# Altium schematic sheet 200_DC-DC.SchDoc: DC_DC Convertion Stage
size A4; Date: xxxxxx; Author: R.Ducuara; DrawnBy: J.Jaramillo; Revision: R1V0; SheetNumber: 3; SheetTotal: 7
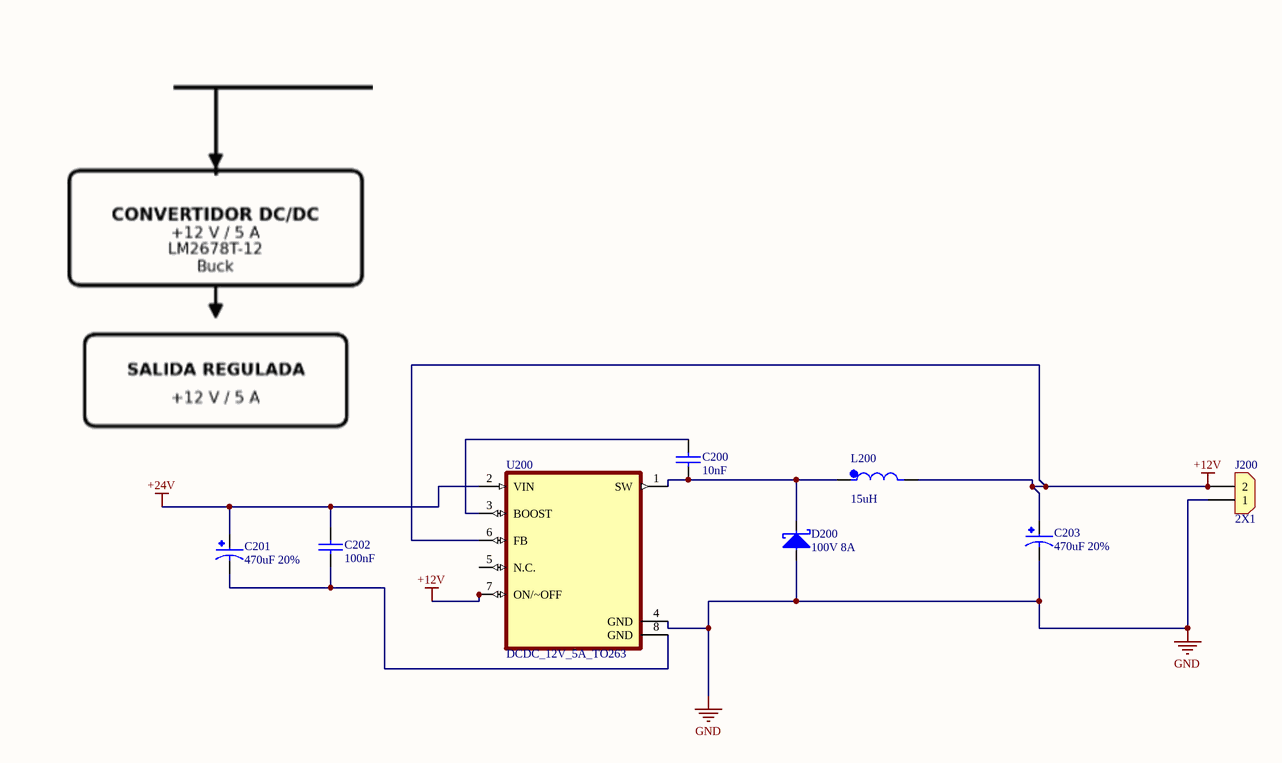
[diagram p0: 200_DC-DC.SchDoc]

## Parts
C200  value 10nF  [0805]  (hidden comment: 10000pF 50V)
C201  470uF 20%  [Cap_470uF_35V_ALUM_RAD]
C202  value 100nF  [1206]  (hidden comment: 100nF 100V)
C203  470uF 20%  [Cap_470uF_35V_ALUM_RAD]
D200  100V 8A  [DO_214AB]
J200  2X1  [CON_2X1_TH_5MM_BAT]
L200  15uH  [L_15uH_7A_SMD]
U200  DCDC_12V_5A_TO263  [DCDC_12V_5A_TO263]

## Nets
+12V: C203.P J200.2 L200.2 U200.6(FB) U200.7(ON/~OFF)
+24V: C201.P C202.1 U200.2(VIN)
GND: C203.N D200.2 J200.1 U200.4(GND)
NetC200_1: C200.1 U200.3(BOOST)
NetC200_2: C200.2 D200.1 L200.1 U200.1(SW)
NetC201_N: C201.N C202.2 U200.8(GND)

Not connected (* = marked no-connect by the designer): U200 5(N.C.)

## Notes on the sheet
- Title:
- Project:
- File:
- Revision:
- Date:
- Size:
- A4
- Drawn by:

## Library data of the parts
C200 = Cap_10000pF_0805_50V: CAP CER 10000PF 50V X7R 0805; Manufacturer: Yageo; Manufacturer Part Number: CC0805JRX7R9BB103; Supplier 1: Digi-Key; Supplier Part Number 1: 311-1857-1-ND; Reel stock: N/A; Last modified by: J.Jaramillo; Last modified date: 20240309; ComponentLink1Description: Digi-Key; ComponentLink1URL: https://www.digikey.com/product-detail/en/yageo/CC0805JRX7R9BB103/311-1857-1-ND/5195759
C201 C203 = Cap_470uF_35V_ALUM_RAD: CAP ALUM 470UF 20% 35V RADIAL TH; Manufacturer: Panasonic Industry; Manufacturer Part Number: ECA-1VM471B; Supplier 1: Digi-Key; Supplier Part Number 1: 10-ECA-1VM471BCT-ND; Last modified by: R.Ducuara; Last modified date: 20261121; Value: 470uF
C202 = Cap_0.1uF_1206_100V: CAP CER 0.1UF 100V X7R 1206; Manufacturer: Samsung Electro-Mechanics; Manufacturer Part Number: CL31B104KCFNNNE; Supplier 1: Digi-Key; Supplier Part Number 1: 1276-1151-1-ND; Last modified by: J.Jaramillo; Last modified date: 20240309; ComponentLink1Description: Digi-Key; ComponentLink1URL: https://www.digikey.com/en/products/detail/samsung-electro-mechanics/CL31B104KCFNNNE/3886809
D200 = D_Schottky_100V_8A_DO_214AB: DIODE SCHOTTKY 100V 8A DO214AB; Manufacturer: Micro Commercial Co; Manufacturer Part Number: SK810L-TP; Supplier 1: Digi-key; Supplier Part Number 1: SK810L-TPMSCT-ND; Reel Stock: N/A; Last modified by: J.Jaramillo; Last modified date: 20240310; ComponentLink1Description: Digi-key; ComponentLink1URL: https://www.digikey.com/en/products/detail/micro-commercial-co/SK810L-TP/2650905?s=N4IgTCBcDaIMoGkAcBGADAGQLQBUAKIAugL5A
J200 = Con_2x1_TH_5mm_Battery: Power Connectors ROHS; Manufacturer: Changzhou Amass Elec; Manufacturer Part Number: XT30U-M; Supplier 1: LCSC; Supplier Part Number 1: C99101; Reel Stock: N/A; Last modified by: J.Jaramillo; Last modified date: 20240310; ComponentLink1Description: Digi-Key; ComponentLink1URL: https://lcsc.com/product-detail/Power-Connectors_Changzhou-Amass-Elec-XT30U-M_C99101.html
L200 = L_15uH_7A_SMD: 15 µH Blindado Núcleo de tambor, cableado Inductivo 7 A 50mOhm máx. No estándar; Manufacturer: Bourns Inc.; Manufacturer Part Number: SRP1040VA-150M; Supplier 1: Digi-key; Supplier Part Number 1: 118-SRP1040VA-150MCT-ND; Reel Stock: N/A; Last modified by: R.Ducuara; Last modified date: 21/11/2026
U200 = DCDC_12V_5A_TO263: IC REG BUCK 12V 5A TO263; Manufacturer: Texas Instruments; Manufacturer Part Number: LM2678S-12; Supplier 1: Digikey; Supplier Part Number 1: LM2678S-12-ND; Reel Stock: N/A; Last modified by: R.Ducuara; Last modified date: 20261120